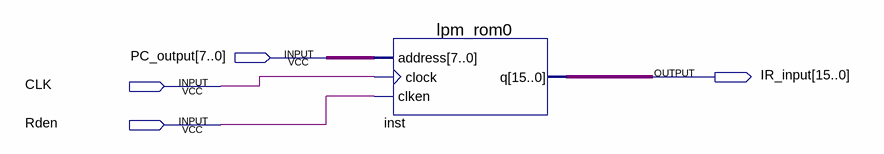
[diagram p0: schematic sheet]
// Quartus schematic IM_cpu_demo.bdf as structural Verilog: 1 symbols, 4 pins
module IM_cpu_demo (
  input  [7:0] PC_output,
  input  CLK,
  input  Rden,
  output [15:0] IR_input
);

  lpm_rom0 inst (.address(PC_output), .clock(CLK), .clken(Rden), .q(IR_input));
endmodule
